# Altium schematic sheet Ethernet_PHY_1.SchDoc
size A4; SheetNumber: 5; SheetTotal: 11
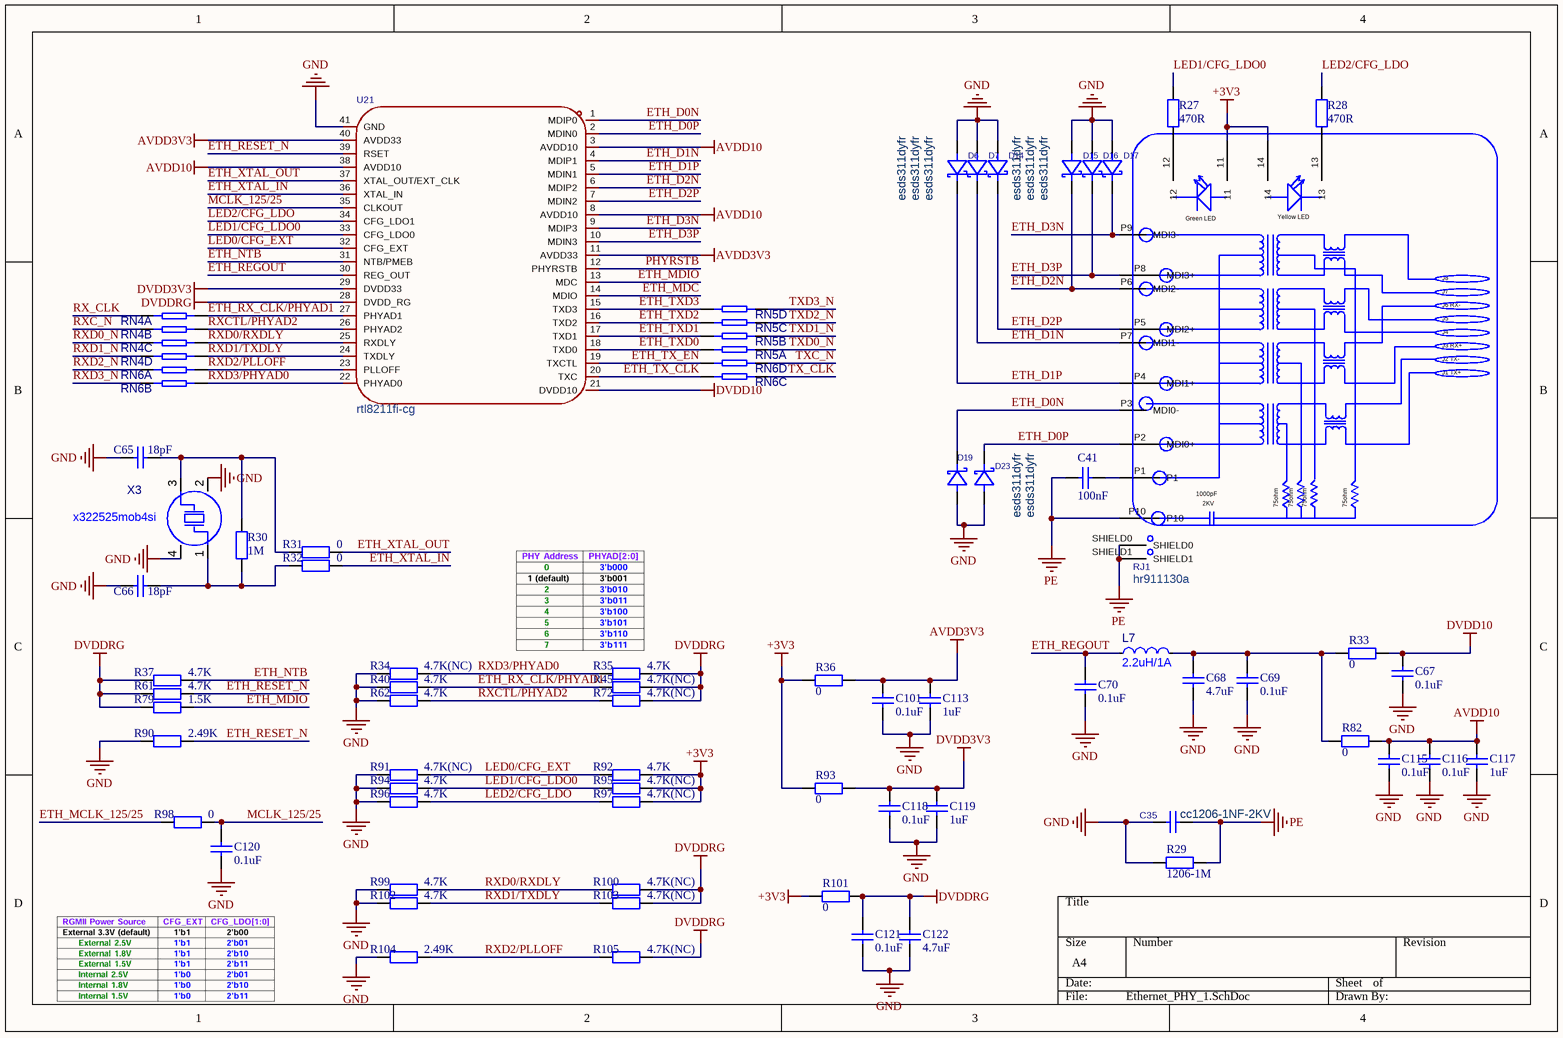
[diagram p0: Ethernet_PHY_1.SchDoc]

## Parts
C35  cc1206-1NF-2KV  [C1206]
C41  100nF  [C0603]
C65  18pF  [C0603]
C66  18pF  [C0603]
C67  0.1uF  [C0603]
C68  4.7uF  [C0603]
C69  0.1uF  [C0603]
C70  0.1uF  [C0603]
C101  0.1uF  [C0603]
C113  1uF  [C0603]
C115  0.1uF  [C0603]
C116  0.1uF  [C0603]
C117  1uF  [C0603]
C118  0.1uF  [C0603]
C119  1uF  [C0603]
C120  0.1uF  [C0603]
C121  0.1uF  [C0603]
C122  4.7uF  [C0603]
D6  esds311dyfr  [SOD-323_L1.7-W1.3-LS2.6-RD-1]
D7  esds311dyfr  [SOD-323_L1.7-W1.3-LS2.6-RD-1]
D14  esds311dyfr  [SOD-323_L1.7-W1.3-LS2.6-RD-1]
D15  esds311dyfr  [SOD-323_L1.7-W1.3-LS2.6-RD-1]
D16  esds311dyfr  [SOD-323_L1.7-W1.3-LS2.6-RD-1]
D17  esds311dyfr  [SOD-323_L1.7-W1.3-LS2.6-RD-1]
D19  esds311dyfr  [SOD-323_L1.7-W1.3-LS2.6-RD-1]
D23  esds311dyfr  [SOD-323_L1.7-W1.3-LS2.6-RD-1]
L7  2.2uH/1A  [L0603]
R27  470R  [R0603]
R28  470R  [R0603]
R29  1206-1M  [F1206]
R30  1M  [R0603]
R31  0  [R0603]
R32  0  [R0603]
R33  0  [R0603]
R34  4.7K(NC)  [R0603]
R35  4.7K  [R0603]
R36  0  [R0603]
R37  4.7K  [R0603]
R40  4.7K  [R0603]
R45  4.7K(NC)  [R0603]
R61  4.7K  [R0603]
R62  4.7K  [R0603]
R72  4.7K(NC)  [R0603]
R79  1.5K  [R0603]
R82  0  [R0603]
R90  2.49K  [R0603]
R91  4.7K(NC)  [R0603]
R92  4.7K  [R0603]
R93  0  [R0603]
R94  4.7K  [R0603]
R95  4.7K(NC)  [R0603]
R96  4.7K  [R0603]
R97  4.7K(NC)  [R0603]
R98  0  [R0603]
R99  4.7K  [R0603]
R100  4.7K(NC)  [R0603]
R101  0  [R0603]
R102  4.7K  [R0603]
R103  4.7K(NC)  [R0603]
R104  2.49K  [R0603]
R105  4.7K(NC)  [R0603]
RJ1  hr911130a  [RJ45-TH_HR911130A]
RN4  4d03wgj0330t5e  [RES-ARRAY-SMD_0603-8P-L3.2-W1.6-BL]  (value not drawn)  (parts A,B,C,D of 4)
RN5  4d03wgj0330t5e  [RES-ARRAY-SMD_0603-8P-L3.2-W1.6-BL]  (value not drawn)  (parts A,B,C,D of 4)
RN6  4d03wgj0330t5e  [RES-ARRAY-SMD_0603-8P-L3.2-W1.6-BL]  (value not drawn)  (parts A,B,C,D of 4)
U21  rtl8211fi-cg  [QFN-40_L5.0-W5.0-P0.40-BL-EP3.7]
X3  x322525mob4si  [CRYSTAL-SMD_4P-L3.2-W2.5-BL]

## Nets
+3V3: R36.2 R92.2 R93.2 R95.2 R97.2 R101.2 RJ1.11 RJ1.14
AVDD3V3: C101.2 C113.2 R36.1 U21.11(AVDD33) U21.40(AVDD33)
AVDD10: C115.2 C116.2 C117.2 R82.1 U21.3(AVDD10) U21.8(AVDD10) U21.38(AVDD10)
DVDD3V3: C118.2 C119.2 R93.1 U21.29(DVDD33)
DVDD10: C67.2 R33.1 U21.21(DVDD10)
DVDDRG: C121.2 C122.2 R35.2 R37.1 R45.2 R61.1 R72.2 R79.1 R100.2 R101.1 R103.2 R105.2 U21.28(DVDD_RG)
GND: C35.1 C65.1 C66.1 C67.1 C68.1 C69.1 C70.1 C101.1 C113.1 C115.1 C116.1 C117.1 C118.1 C119.1 C120.1 C121.1 C122.1 D6.2(A) D7.2(A) D14.2(A) D15.2(A) D16.2(A) D17.2(A) D19.2(A) D23.2(A) R29.1 R34.1 R40.1 R62.1 R90.1 R91.1 R94.1 R96.1 R99.1 R102.1 R104.1 U21.41(GND) X3.2(GND) X3.4(GND)
PE: C35.2 C41.1 R29.2 RJ1.P10 RJ1.SHIELD0 RJ1.SHIELD1
ETH_D0N: D19.1(K) RJ1.P3(MDI0-) U21.1(MDIP0)
ETH_D0P: D23.1(K) RJ1.P2(MDI0+) U21.2(MDIN0)
ETH_D1N: D7.1(K) RJ1.P7(MDI1-) U21.4(MDIP1)
ETH_D1P: D6.1(K) RJ1.P4(MDI1+) U21.5(MDIN1)
ETH_D2N: D15.1(K) RJ1.P6(MDI2-) U21.6(MDIP2)
ETH_D2P: D14.1(K) RJ1.P5(MDI2+) U21.7(MDIN2)
ETH_D3N: D17.1(K) RJ1.P9(MDI3-) U21.9(MDIP3)
ETH_D3P: D16.1(K) RJ1.P8(MDI3+) U21.10(MDIN3)
ETH_MCLK_125/25: R98.1
ETH_MDC: U21.14(MDIO)
ETH_MDIO: R79.2 U21.13(MDC)
ETH_NTB: R37.2 U21.31(NTB/PMEB)
ETH_REGOUT: C70.2 L7.1 U21.30(REG_OUT)
ETH_RESET_N: R61.2 R90.2 U21.39(RSET)
ETH_RX_CLK/PHYAD1: R40.2 R45.1 RN4.8 U21.27(PHYAD1)
ETH_TX_CLK: RN6.3 U21.20(TXC)
ETH_TX_EN: RN6.4 U21.19(TXCTL)
ETH_TXD0: RN5.1 U21.18(TXD0)
ETH_TXD1: RN5.2 U21.17(TXD1)
ETH_TXD2: RN5.3 U21.16(TXD2)
ETH_TXD3: RN5.4 U21.15(TXD3)
ETH_XTAL_IN: R32.2 U21.36(XTAL_IN)
ETH_XTAL_OUT: R31.2 U21.37(XTAL_OUT/EXT_CLK)
LED0/CFG_EXT: R91.2 R92.1 U21.32(CFG_EXT)
LED1/CFG_LDO0: R27.2 R94.2 R95.1 U21.33(CFG_LDO0)
LED2/CFG_LDO: R28.2 R96.2 R97.1 U21.34(CFG_LDO1)
MCLK_125/25: C120.2 R98.2 U21.35(CLKOUT)
PHYRSTB: U21.12(PHYRSTB)
RX_CLK: RN4.1
RXC_N: RN4.2
RXCTL/PHYAD2: R62.2 R72.1 RN4.7 U21.26(PHYAD2)
RXD0/RXDLY: R99.2 R100.1 RN4.6 U21.25(RXDLY)
RXD0_N: RN4.3
RXD1/TXDLY: R102.2 R103.1 RN4.5 U21.24(TXDLY)
RXD1_N: RN4.4
RXD2/PLLOFF: R104.2 R105.1 RN6.8 U21.23(PLLOFF)
RXD2_N: RN6.1
RXD3/PHYAD0: R34.2 R35.1 RN6.7 U21.22(PHYAD0)
RXD3_N: RN6.2
TX_CLK: RN6.6
TXC_N: RN6.5
TXD0_N: RN5.8
TXD1_N: RN5.7
TXD2_N: RN5.6
TXD3_N: RN5.5
NetC41_2: C41.2 RJ1.P1
NetC65_2: C65.2 R30.2 R31.1 X3.3(OSC2)
NetC66_2: C66.2 R30.1 R32.1 X3.1(OSC1)
NetC68_2: C68.2 C69.2 L7.2 R33.2 R82.2
NetR27_1: R27.1 RJ1.12
NetR28_1: R28.1 RJ1.13

## Notes on the sheet
- (in symbol hr911130a) Green LED; Yellow LED; J8; J7; J6 RX-; J5; J4; J3 RX+; J2 TX-; J1 TX+; 1000pF; 75ohm; 2KV

## Library data of the parts
C35 = cc1206kkx7rdbb102: 容值:1nF;精度:±10%;额定电压:2kV;温度系数:X7R;; Manufacturer: YAGEO(国巨); AddInBom: yes; ModelId: e4be705b945545a48e666415e3682bd8; ModelName: C1206_L3.2-W1.6-H1.3; ModelTransform: 125.984,62.992,0,0,0,0,0,0,0; Value: 1nF; Tolerance: ±10%; Voltage Rating: 2kV; Temperature Coefficient: X7R; Symbol: CC1206KKX7RDBB102; LCSC Part Name: 1nF ±10% 2kV; SupplierPart: C23631; ManufacturerPart: CC1206KKX7RDBB102; Supplier Footprint: 1206; JLCPCB Part Class: Extended Part; Datasheet: https://item.szlcsc.com/datasheet/CC1206KKX7RDBB102/24367.html; Supplier: LCSC; ConvertToPcb: yes; FootprintName: C1206
C41 C65-C70 C101 C113 C115-C122 = C0603: Capacitor; Value: 104; Published: 8-Jun-2000; LatestRevisionDate: 17-Jul-2002; LatestRevisionNote: Re-released for DXP Platform.; Publisher: Altium Limited
D6 D7 D14-D17 D19 D23 = esds311dyfr: 极性:单向;反向截止电压(Vrwm):3.6V;钳位电压:7.7V;峰值脉冲电流(Ipp):25A@8/20us;峰值脉冲功率(Ppp):170W@8/20us;击穿电压(VBR):7.5V;; Manufacturer: TI(德州仪器); AddInBom: yes; ModelId: eba151483b2844ffacda3a6d97308fa1; ModelTransform: 100.394,49.2125,0,0,0,0,0,0,0; Polarity: 单向; Reverse Stand-Off Voltage (Vrwm): 3.6V; Clamping Voltage: 7.7V; Voltage - Breakdown: 7.5V; Reverse Leakage Current (Ir): 5nA; Number of Channels: 单路; level of protection: IEC 61000-4-4；IEC 61000-4-5；IEC 61000-4-2; Type: TVS; Junction Capacitance: 4.5pF; LCSC Part Name: 单向TVS 3.6V截止 峰值浪涌电流：25A@8/20us; SupplierPart: C30938562; ManufacturerPart: ESDS311DYFR; Supplier Footprint: SOD-323; JLCPCB Part Class: Extended Part; Datasheet: https://www.ti.com.cn/cn/lit/ds/symlink/esds311.pdf?ts=1736913524660&ref_url=https%253A%252F%252Fwww.ti.com.cn%252Fsitesearch%252Fzh-cn%252Fdocs%252Funiversalsearch.tsp%253FlangPref%253Dzh-CN%2526nr%253D9%2526searchTerm%253DESDS311DYFR; Supplier: LCSC; ConvertToPcb: yes; SymbolName: ESDS311DYFR; FootprintName: SOD-323_L1.7-W1.3-LS2.6-RD-1; ModelName: SOD-323_L1.7-W1.3-LS2.6-RD-1; Peak Pulse Current (Ipp): 25A@8/20us; Peak Pulse Power Dissipation (Ppp): 170W@8/20us; Operating Temperature: -40℃~+125℃
L7 = L0603: 电感值:10uH;精度:±10%;额定电流:3mA;饱和电流(Isat):-;直流电阻(DCR):1.85Ω;; Manufacturer: Sunlord(顺络); Symbol: SDFL1608S100KTF; AddInBom: yes; ModelId: 2bc5ec593d464d6ba9807aec0b5673c2; ModelName: L0603_L1.6-W0.8-H0.5_BEAD; ModelTransform: 62.992,31.496,0,180,0,0,0.094,0.629,0; Value: 10uH; Tolerance: ±10%; Current Rating: 3mA; DC Resistance(DCR): 1.85Ω; Q @ Frequency: 30@2MHz; Frequency - Self Resonant: 17MHz; LCSC Part Name: 10uH ±10%; SupplierPart: C1035; ManufacturerPart: SDFL1608S100KTF; Supplier Footprint: 0603; JLCPCB Part Class: Basic Part; Datasheet: https://item.szlcsc.com/datasheet/SDFL1608S100KTF/1387.html; Supplier: LCSC; ConvertToPcb: yes; FootprintName: L0603; Current - Saturation (Isat): -; Ratings: -
R27 R28 R30-R37 R40 R45 R61 R62 R72 R79 R82 R90-R105 = R0603: Resistor; Published: 8-Jun-2000; LatestRevisionDate: 17-Jul-2002; LatestRevisionNote: Re-released for DXP Platform.; Publisher: Altium Limited
R29 = R1206: 特性：I Hold：0.05 ~ 3.0A。 快速响应故障电流。 尺寸1206 / 3.2×1.6mm。 低电阻。 低轮廓。 符合RoHS标准，无铅且无卤。应用：USB集线器、端口和外围设备。 计算机、手机、多媒体设备; Published: 8-Jun-2000; LatestRevisionDate: 17-Jul-2002; LatestRevisionNote: Re-released for DXP Platform.; Publisher: Altium Limited
RJ1 = hr911130a: 连接器类型:RJ45插座;安装方式:弯插;端口数量:1;LED:带LED;屏蔽:有屏蔽;等级:-;触头材质:磷青铜;触头镀层:金;工作温度:0℃~+70℃;; Manufacturer: HANRUN(汉仁); AddInBom: yes; ModelId: 21112b2bcfef4316930bd636ff253b92; ModelTransform: 635.432,838.62,0,180,0,0,0,88.937,-157.48; Connector Type: RJ45插座; Number of Ports: 1; LED: 带LED; Shielding: 有屏蔽; PoE: 不带PoE; Supplementary Features: 带十字脚; Symbol: HR911130A; LCSC Part Name: 弯插 带LED; SupplierPart: C54408; ManufacturerPart: HR911130A; Supplier Footprint: 插件; JLCPCB Part Class: Extended Part; Datasheet: https://item.szlcsc.com/datasheet/HR911130A/55426.html; Supplier: LCSC; ConvertToPcb: yes; FootprintName: RJ45-TH_HR911130A; ModelName: RJ45-TH_HR911130A; Mounting Type: 弯插; Ratings: -; Contact Material: 磷青铜; Contact Plating: 金; Operating Temperature: 0℃~+70℃; Length: 21.2mm; Width: 16mm; Height: 13.3mm
RN4-RN6 = 4d03wgj0330t5e: 电阻器数:4;阻值:33Ω;精度:±5%;单个元件功率:62.5mW;温度系数:±200ppm/℃;; Manufacturer: UNI-ROYAL(厚声); AddInBom: yes; ModelId: edf39f9a2dca4b9a94267f442dd4f95a; ModelName: R0603-8P_L3.2-W1.6-H0.6; ModelTransform: 125.984,62.992,0,0,0,0,0,0,0; Number of Resistors: 4; Value: 33Ω; Tolerance: ±5%; Power(Watts): 62.5mW; Symbol: 4D03WGJ0330T5E; LCSC Part Name: 33Ω ±5%; SupplierPart: C25508; ManufacturerPart: 4D03WGJ0330T5E; Supplier Footprint: 0603x4; JLCPCB Part Class: Extended Part; Datasheet: https://atta.szlcsc.com/upload/public/pdf/source/20191224/C474318_2527498AE30E813171187CCD28401A71.pdf; Supplier: LCSC; ConvertToPcb: yes; FootprintName: RES-ARRAY-SMD_0603-8P-L3.2-W1.6-BL; Temperature Coefficient: ±200ppm/℃; Number of Pins: 8
U21 = rtl8211fi-cg: 类型:以太网收发器;端口数量:-;MAC接口:RGMII;; Manufacturer: REALTEK(瑞昱); AddInBom: yes; ModelId: f658c93bb71c4057b80d8d21cfcdd805; ModelName: QFN-40_L5.0-W5.0-H0.9-P0.4-BL-EP; ModelTransform: 196.85,196.85,0,90,0,0,0,0,0; MAC Interface: RGMII; Ethernet Speed Standards: 1000BASE-T；10BASE-T；100BASE-TX; Data Rate: 10Mbit/s；100Mbit/s；1Gbit/s; Voltage - Supply: 1.8V；2.5V；3.3V；1.5V; Symbol: RTL8211FI-CG; LCSC Part Name: 集成10/100/1000M以太网精密收发器; SupplierPart: C717681; ManufacturerPart: RTL8211FI-CG; Supplier Footprint: QFN-40-EP(5x5); JLCPCB Part Class: Extended Part; Supplier: LCSC; ConvertToPcb: yes; FootprintName: QFN-40_L5.0-W5.0-P0.40-BL-EP3.7; Type: 以太网收发器; Number of ports: -
X3 = x322525mob4si: 晶振类型:贴片晶振;频率:25MHz;常温频差:±10ppm;负载电容:12pF;频率稳定度:±20ppm;; Manufacturer: YXC(扬兴晶振); AddInBom: yes; ModelId: ff2dfd5650294453a14147960efe1838; ModelTransform: 125.984,98.425,0,0,0,0,0,0,0; Value: 25MHz; Normal temperature Frequency Tolerance: ±10ppm; Load Capacitance: 12pF; Frequency Stability: ±20ppm; Symbol: X322525MOB4SI; LCSC Part Name: YSX321SL 25MHZ 4P 3225 12PF ±10PPM -40~85℃ (±20PPM); SupplierPart: C9006; ManufacturerPart: X322525MOB4SI; Supplier Footprint: SMD3225-4P; JLCPCB Part Class: Basic Part; Datasheet: https://item.szlcsc.com/datasheet/X322525MOB4SI/9526.html; Supplier: LCSC; ConvertToPcb: yes; FootprintName: CRYSTAL-SMD_4P-L3.2-W2.5-BL; ModelName: CRYSTAL-SMD_4P-L3.2-W2.5-BL; Type: 贴片晶振; Operating Temperature: -40℃~+85℃